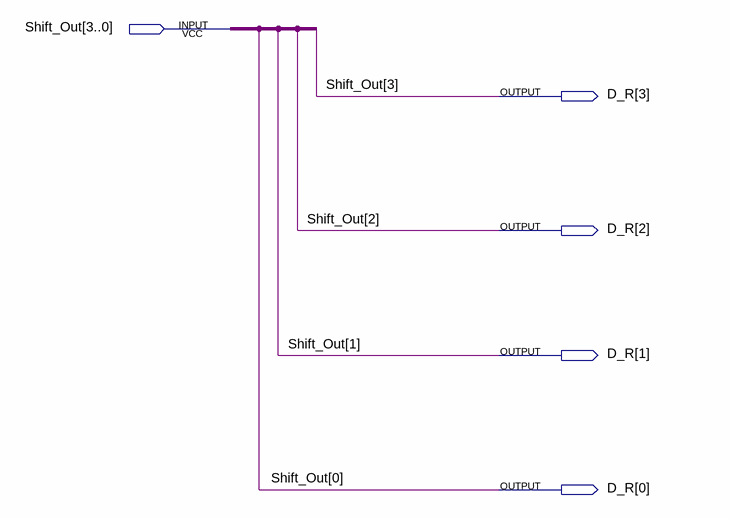
[diagram p0: schematic sheet]
// Quartus schematic D_R2.bdf as structural Verilog: 0 symbols, 5 pins
module D_R2 (
  input  [3:0] Shift_Out,
  output [3:0] D_R
);


  assign D_R = Shift_Out;
endmodule
